# Altium schematic sheet 07_JTAG_UART.SchDoc
size 599 x 420 mm; SheetNumber: 7; SheetTotal: 7
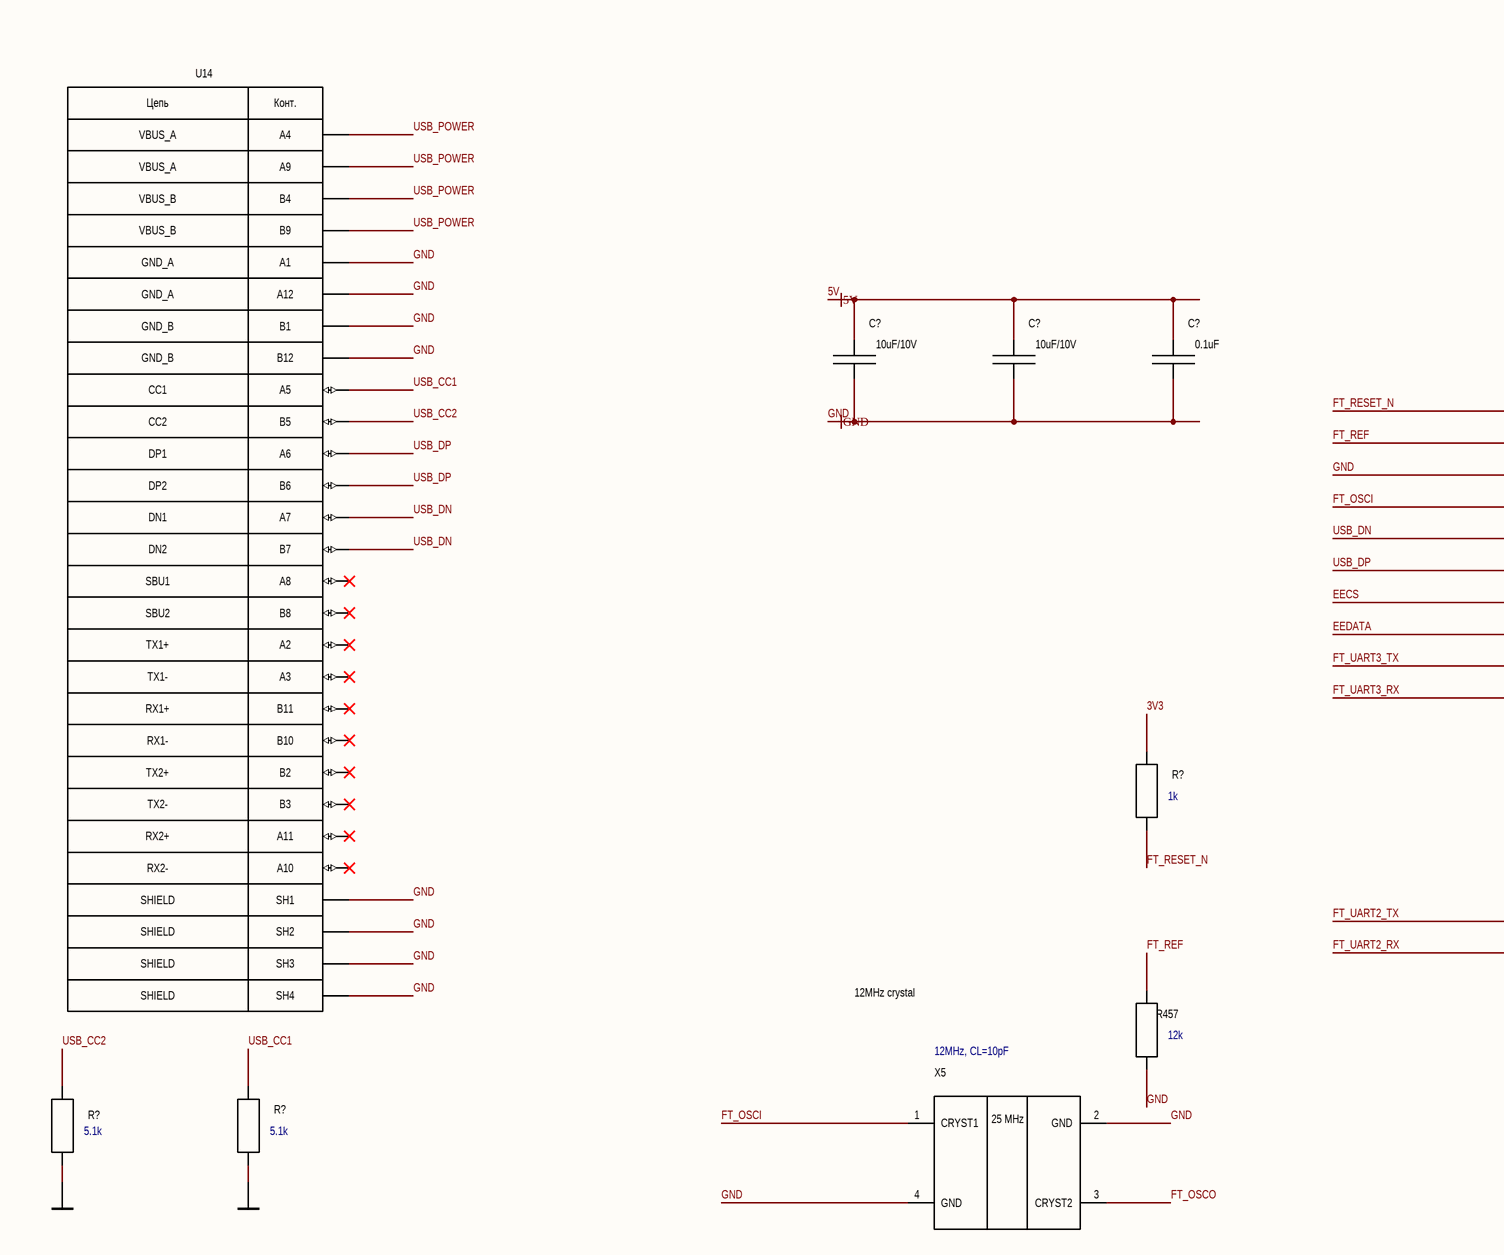
[diagram p0: 07_JTAG_UART.SchDoc, top left]
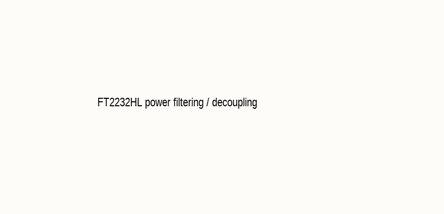
[diagram p1: 07_JTAG_UART.SchDoc, top right]
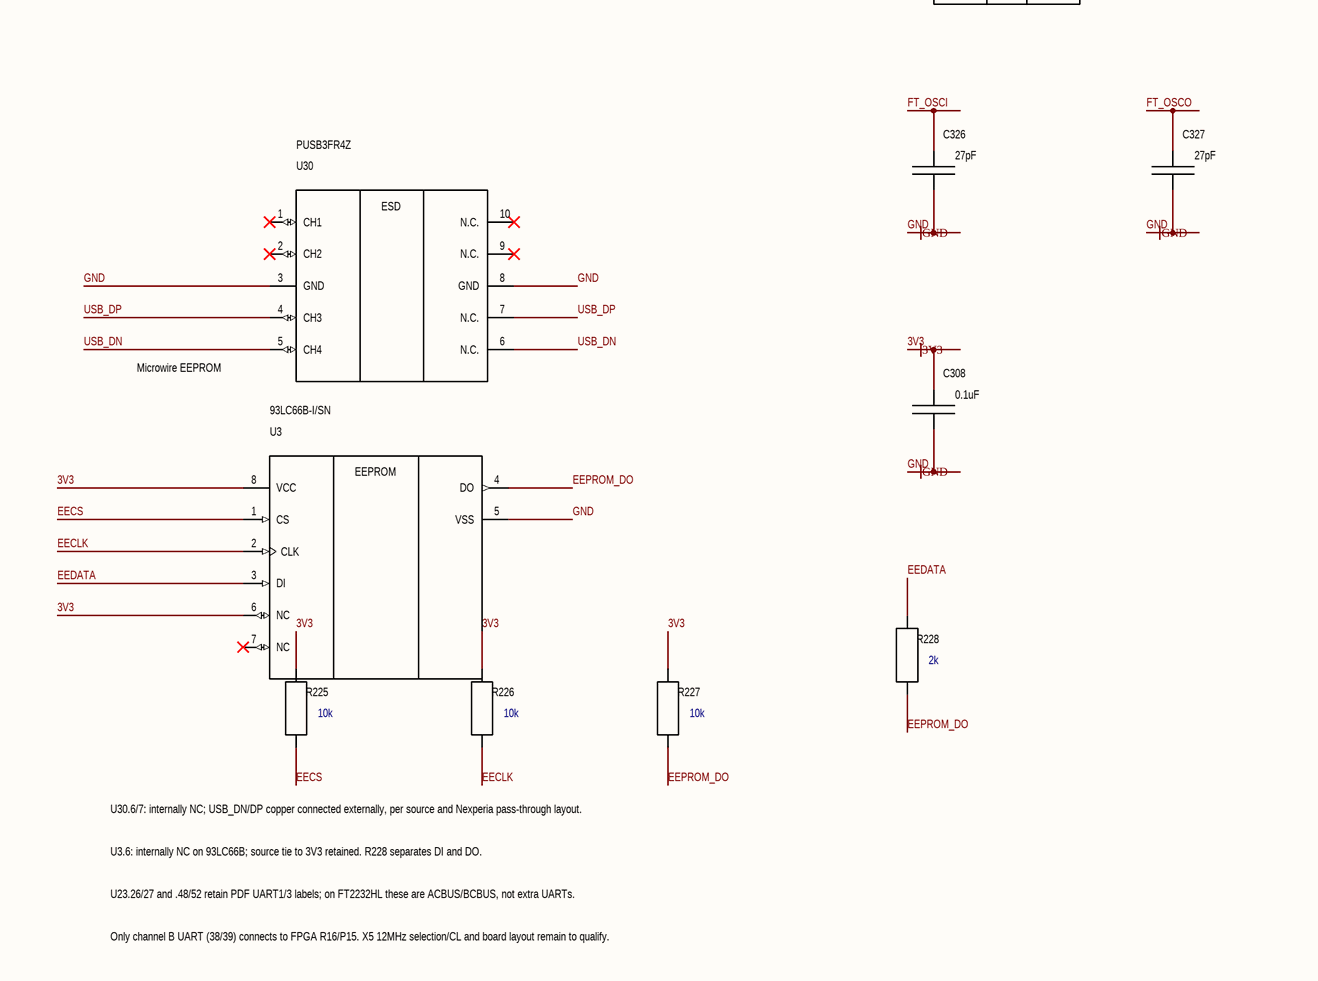
[diagram p2: 07_JTAG_UART.SchDoc, bottom left]
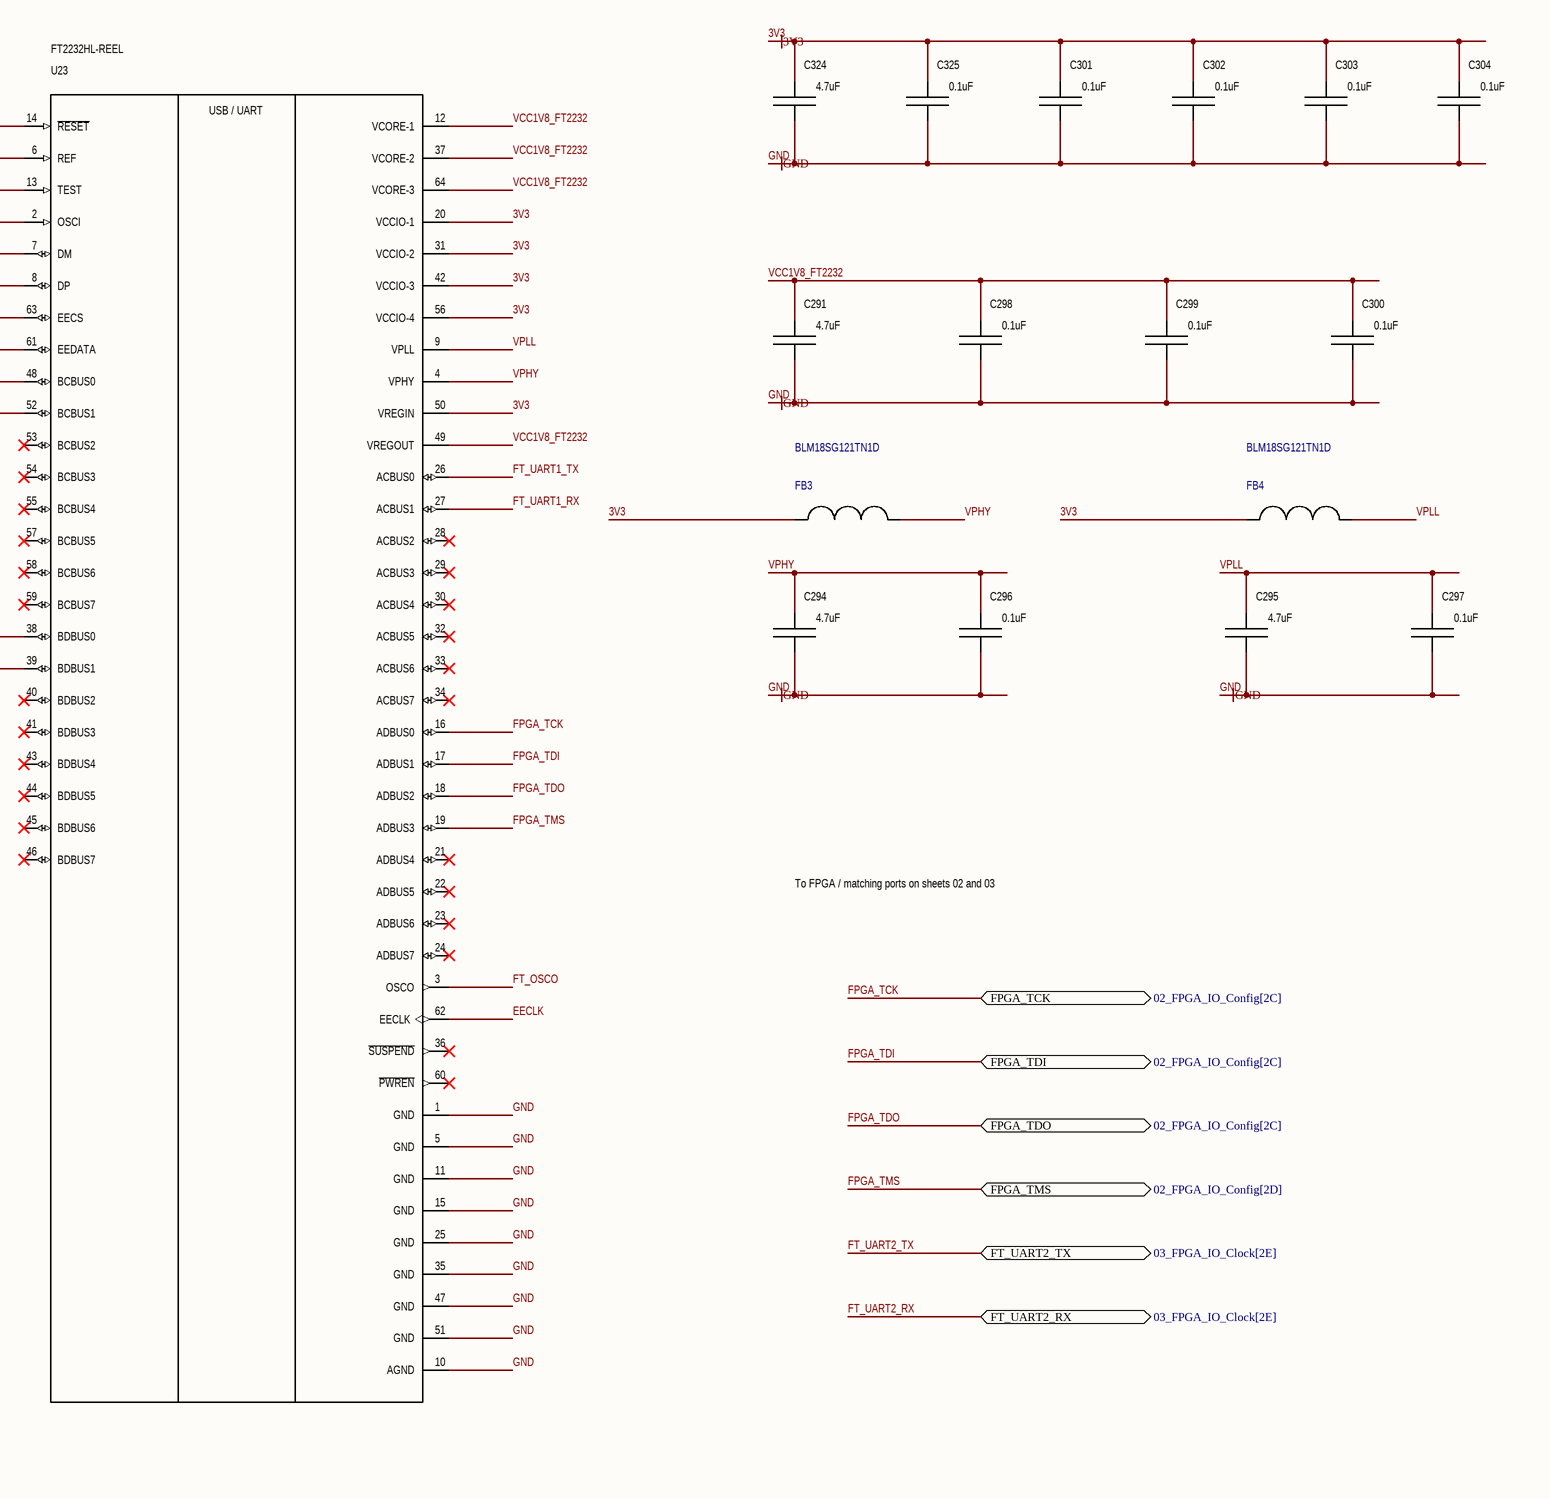
[diagram p3: 07_JTAG_UART.SchDoc, bottom right]

## Parts
(Parts that share a designator on the sheet are numbered #1, #2 ... from top to bottom, then left to right.)
C291  4.7uF  [C_0805]
C294  4.7uF  [C_0805]
C295  4.7uF  [C_0805]
C296  0.1uF  [C_0805]
C297  0.1uF  [C_0805]
C298  0.1uF  [C_0805]
C299  0.1uF  [C_0805]
C300  0.1uF  [C_0805]
C301  0.1uF  [C_0805]
C302  0.1uF  [C_0805]
C303  0.1uF  [C_0805]
C304  0.1uF  [C_0805]
C308  0.1uF  [C_0805]
C324  4.7uF  [C_0805]
C325  0.1uF  [C_0805]
C326  27pF  [C_0805]
C327  27pF  [C_0805]
C?#1  10uF/10V  [C_0805]
C?#2  10uF/10V  [C_0805]
C?#3  0.1uF  [C_0805]
FB3  BLM18SG121TN1D  [FP-BLM18-0_15-t0_5-d1_2-IPC_B]
FB4  BLM18SG121TN1D  [FP-BLM18-0_15-t0_5-d1_2-IPC_B]
R225  10k  [R_0603]
R226  10k  [R_0603]
R227  10k  [R_0603]
R228  2k  [R_0603]
R457  12k  [R_0603]
R?#1  1k  [R_0603]
R?#2  5.1k  [R_0603]
R?#3  5.1k  [R_0603]
U3  93LC66B-I/SN  [SOIC127P600X175-8N]
U14  (no value)  [TE_2345986-1]
U23  FT2232HL-REEL  [QFP50P1200X1200X160-64N]
U30  PUSB3FR4Z  [U_PUSB3FR4Z_NEX]
X5  12MHz, CL=10pF  [HKC3225SX25MHZ26594R4V1]

## Ports
FPGA_TCK (bidir, see 02_FPGA_IO_Config[2C]), FPGA_TDI (bidir, see 02_FPGA_IO_Config[2C]), FPGA_TDO (bidir, see 02_FPGA_IO_Config[2C]), FPGA_TMS (bidir, see 02_FPGA_IO_Config[2D]), FT_UART2_RX (bidir, see 03_FPGA_IO_Clock[2E]), FT_UART2_TX (bidir, see 03_FPGA_IO_Clock[2E])

## Nets
3V3: C301.2 C302.2 C303.2 C304.2 C308.2 C324.2 C325.2 FB3.1 FB4.1 R225.2 R226.2 R227.2 R?#1.2 U3.6(NC) U3.8(VCC) U23.20(VCCIO-1) U23.31(VCCIO-2) U23.42(VCCIO-3) U23.50(VREGIN) U23.56(VCCIO-4)
5V: C?#1.2 C?#2.2 C?#3.2
GND: C291.1 C294.1 C295.1 C296.1 C297.1 C298.1 C299.1 C300.1 C301.1 C302.1 C303.1 C304.1 C308.1 C324.1 C325.1 C326.1 C327.1 C?#1.1 C?#2.1 C?#3.1 R457.1 R?#2.1 R?#3.1 U3.5(VSS) U14.A1(GND_A) U14.A12(GND_A) U14.B1(GND_B) U14.B12(GND_B) U14.SH1(SHIELD) U14.SH2(SHIELD) U14.SH3(SHIELD) U14.SH4(SHIELD) U23.1(GND) U23.5(GND) U23.10(AGND) U23.11(GND) U23.13(TEST) U23.15(GND) U23.25(GND) U23.35(GND) U23.47(GND) U23.51(GND) U30.3(GND) U30.8(GND) X5.2(GND) X5.4(GND)
EECLK: R226.1 U3.2(CLK) U23.62(EECLK)
EECS: R225.1 U3.1(CS) U23.63(EECS)
EEDATA: R228.2 U3.3(DI) U23.61(EEDATA)
EEPROM_DO: R227.1 R228.1 U3.4(DO)
FPGA_TCK: U23.16(ADBUS0) ; port FPGA_TCK
FPGA_TDI: U23.17(ADBUS1) ; port FPGA_TDI
FPGA_TDO: U23.18(ADBUS2) ; port FPGA_TDO
FPGA_TMS: U23.19(ADBUS3) ; port FPGA_TMS
FT_OSCI: C326.2 U23.2(OSCI) X5.1(CRYST1)
FT_OSCO: C327.2 U23.3(OSCO) X5.3(CRYST2)
FT_REF: R457.2 U23.6(REF)
FT_RESET_N: R?#1.1 U23.14(~{RESET})
FT_UART1_RX: U23.27(ACBUS1)
FT_UART1_TX: U23.26(ACBUS0)
FT_UART2_RX: U23.39(BDBUS1) ; port FT_UART2_RX
FT_UART2_TX: U23.38(BDBUS0) ; port FT_UART2_TX
FT_UART3_RX: U23.52(BCBUS1)
FT_UART3_TX: U23.48(BCBUS0)
USB_CC1: R?#3.2 U14.A5(CC1)
USB_CC2: R?#2.2 U14.B5(CC2)
USB_DN: U14.A7(DN1) U14.B7(DN2) U23.7(DM) U30.5(CH4) U30.6(N.C.)
USB_DP: U14.A6(DP1) U14.B6(DP2) U23.8(DP) U30.4(CH3) U30.7(N.C.)
USB_POWER: U14.A4(VBUS_A) U14.A9(VBUS_A) U14.B4(VBUS_B) U14.B9(VBUS_B)
VCC1V8_FT2232: C291.2 C298.2 C299.2 C300.2 U23.12(VCORE-1) U23.37(VCORE-2) U23.49(VREGOUT) U23.64(VCORE-3)
VPHY: C294.2 C296.2 FB3.2 U23.4(VPHY)
VPLL: C295.2 C297.2 FB4.2 U23.9(VPLL)

Not connected (* = marked no-connect by the designer): U3 7(NC)*; U14 A2(TX1+)* A3(TX1-)* A8(SBU1)* A10(RX2-)* A11(RX2+)* B2(TX2+)* B3(TX2-)* B8(SBU2)* B10(RX1-)* B11(RX1+)*; U23 21(ADBUS4)* 22(ADBUS5)* 23(ADBUS6)* 24(ADBUS7)* 28(ACBUS2)* 29(ACBUS3)* 30(ACBUS4)* 32(ACBUS5)* 33(ACBUS6)* 34(ACBUS7)* 36(~{SUSPEND})* 40(BDBUS2)* 41(BDBUS3)* 43(BDBUS4)* 44(BDBUS5)* 45(BDBUS6)* 46(BDBUS7)* 53(BCBUS2)* 54(BCBUS3)* 55(BCBUS4)* 57(BCBUS5)* 58(BCBUS6)* 59(BCBUS7)* 60(~{PWREN})*; U30 1(CH1)* 2(CH2)* 9(N.C.)* 10(N.C.)*

## Notes on the sheet
- FT2232HL power filtering / decoupling
- 12MHz crystal
- To FPGA / matching ports on sheets 02 and 03
- Microwire EEPROM
- U30.6/7: internally NC; USB_DN/DP copper connected externally, per source and Nexperia pass-through layout.
- U3.6: internally NC on 93LC66B; source tie to 3V3 retained. R228 separates DI and DO.
- U23.26/27 and .48/52 retain PDF UART1/3 labels; on FT2232HL these are ACBUS/BCBUS, not extra UARTs.
- Only channel B UART (38/39) connects to FPGA R16/P15. X5 12MHz selection/CL and board layout remain to qualify.
- (in symbol 93LC66B-I/SN) EEPROM
- (in symbol 2345986-1) Цепь; Конт.
- (in symbol FT2232HL-REEL) USB / UART
- (in symbol HKC3225SX-25MHZ-26594-R4V1) 25 MHz
- (in symbol PUSB3FR4Z) ESD

## Library data of the parts
C291 C294-C304 C308 C324-C327 C?#1-C?#3 = Конденсатор GRM21BR61A106K (10 мкФ +-10% X5R 10В): Capacitance: 10u; Tolerance: ±10%; Dielectric Type: X5R; Maximum Voltage: 10V; Part Number: Конденсатор GRM21BR61A106K (10 мкФ +-10% X5R 10В); HelpURL: http://search.murata.co.jp/Ceramy/image/img/A01X/G101/ENG/GRM21BR61A106KE14-01.pdf
FB3 FB4 = CMP-0686-00602-4: Chip Ferrite Bead, 0603, 120Ω @ 100MHz, 25%, 0.025Ω, 3A; DC Resistance (DCR): 25mR; Shielding: Unshielded; Material: Steel; Number of Circuits: 1; Impedance: 120R; Tolerance: 25%; REACH SVHC: No SVHC; Case/Package: 0603; Max DC Current: 3A; Core Material: Ferrite; Case Code (Metric): 1608; Frequency: 100MHz; Package Quantity: 1; Height: 0.8mm; Lead Free: Lead Free; Test Frequency: 100MHz; RoHS Compliant: Yes; DC Resistance-Max: 25mR; Min Operating Temperature: -55°C; Width: 0.8mm; Termination: SMD/SMT; Length: 1.6mm; Max Current Rating: 3A; Number of Lines: 1; Series: BLM18S; Number of Pins: 2; Packaging: Tape and Reel; Current Rating: 3A; Depth: 0.8mm; Case Code (Imperial): 0603; Max Operating Temperature: 125°C
R225-R227 = Резистор RC0603JR-0710KL (10 кОм +-5%): Tolerance: ±5%; Power: 0.1 W; Maximum Working Voltage: 50V; Maximum Overload Voltage: 100V; Part Number: Резистор RC0603JR-0710KL (10 кОм +-5%); HelpURL: http://www.yageo.ru/pdf/RC0603.pdf; Resistance: 10k
R228 R457 R?#1-R?#3 = Резистор RC0603JR-0710KL (10 кОм +-5%): Resistance: 10k; Tolerance: ±5%; Power: 0.1 W; Maximum Working Voltage: 50V; Maximum Overload Voltage: 100V; Part Number: Резистор RC0603JR-0710KL (10 кОм +-5%); HelpURL: http://www.yageo.ru/pdf/RC0603.pdf
U3 = 93LC66B-I/SN: Microchip 93LC66B-I/SN Serial EEPROM Memory, 4kbit, 2.5 to 5.5 V 8-Pin SOIC | Microchip Technology Inc. 93LC66B-I/SN; SnapEDA_Link: https://www.snapeda.com/parts/93LC66B-I/SN/Microchip+Technology/view-part/?ref=snap; Package: SOIC-8 Microchip; Value: *; MF: Microchip; MP: 93LC66B-I/SN; Check_prices: https://www.snapeda.com/parts/93LC66B-I/SN/Microchip+Technology/view-part/?ref=eda
U14 = 2345986-1: Package: None; Price: None; Value: *; MP: 2345986-1; Availability: Unavailable
U23 = FT2232HL-REEL: USB Hi-Speed to Dual Channel Serial UART/FIFO/JTAG/SPI/I2C IC - LQFP-64; MF: {'manufacturer': u'FTDI, Future Technology Devices International Ltd'}; Package: None; Price: None; Value: *; MP: FT2232HL-REEL; Availability: Unavailable
U30 = PUSB3FR4Z: Description; Manufacturer_Name: Nexperia; Copyright: Copyright (C) 2026 Ultra Librarian. All rights reserved.; Manufacturer_Part_Number: PUSB3FR4Z; RefDes: RefDes; Type: Type
X5 = HKC3225SX-25MHZ-26594-R4V1: 3225 Ceramic SMD Crystals, 25 MHz; Manufacturer_Name: Hong Kong XвЂ™tals Limited; Geometry.Height: 0.8mm; Manufacturer_Part_Number: HKC3225SX-25MHZ-26594-R4V1; Mouser Part Number: *; Mouser Price/Stock: *; Arrow Part Number: *; Arrow Price/Stock: *; Datasheet Link: https://cms.nacsemi.com/content/AuthDatasheets/HKCrystal/C7.pdf